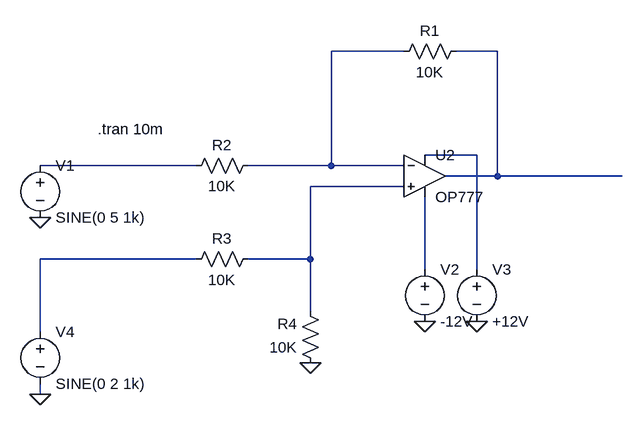
[diagram p0: schematic subtractor1.asc]
subtractor1.asc, the LTspice schematic file:
Version 4.1
SHEET 1 880 680
WIRE 160 -64 48 -64
WIRE 304 -64 240 -64
WIRE 272 96 192 96
WIRE -160 112 -400 112
WIRE 48 112 48 -64
WIRE 48 112 -80 112
WIRE 160 112 48 112
WIRE 304 128 304 -64
WIRE 304 128 224 128
WIRE 496 128 304 128
WIRE 160 144 16 144
WIRE -160 256 -400 256
WIRE 16 256 16 144
WIRE 16 256 -80 256
WIRE 192 272 192 160
WIRE 272 272 272 96
WIRE 16 336 16 256
WIRE -400 368 -400 256
WIRE -400 464 -400 448
FLAG -400 192 0
FLAG 192 352 0
FLAG 272 352 0
FLAG -400 464 0
FLAG 16 416 0
SYMBOL res -64 96 R90
WINDOW 0 0 56 VBottom 2
WINDOW 3 32 56 VTop 2
SYMATTR InstName R2
SYMATTR Value 10K
SYMATTR SpiceLine tol=1 pwr=0.1
SYMBOL voltage -400 96 R0
WINDOW 123 0 0 Left 0
WINDOW 39 24 124 Left 2
SYMATTR InstName V1
SYMATTR Value SINE(0 5 1k)
SYMBOL voltage 192 256 R0
WINDOW 123 0 0 Left 0
WINDOW 39 0 0 Left 0
SYMATTR InstName V2
SYMATTR Value -12V
SYMBOL voltage 272 256 R0
WINDOW 123 0 0 Left 0
WINDOW 39 0 0 Left 0
SYMATTR InstName V3
SYMATTR Value +12V
SYMBOL OpAmps\\OP777 192 64 R0
SYMATTR InstName U2
SYMBOL res -176 272 R270
WINDOW 0 32 56 VTop 2
WINDOW 3 0 56 VBottom 2
SYMATTR InstName R3
SYMATTR Value 10K
SYMATTR SpiceLine tol=1 pwr=0.1
SYMBOL voltage -400 352 R0
WINDOW 123 0 0 Left 0
WINDOW 39 0 0 Left 0
SYMATTR InstName V4
SYMATTR Value SINE(0 2 1k)
SYMBOL res 256 -80 R90
WINDOW 0 0 56 VBottom 2
WINDOW 3 32 56 VTop 2
SYMATTR InstName R1
SYMATTR Value 10K
SYMATTR SpiceLine tol=1 pwr=0.1
SYMBOL res 32 432 R180
WINDOW 0 36 76 Left 2
WINDOW 3 36 40 Left 2
SYMATTR InstName R4
SYMATTR Value 10K
SYMATTR SpiceLine tol=1 pwr=0.1
TEXT -312 56 Left 2 !.tran 10m

The netlist it stands for:
* subtractor1.asc
R2 N001 N004 10K tol=1 pwr=0.1
V1 N004 0 SINE(0 5 1k)
V2 N007 0 -12V
V3 N003 0 +12V
X§U2 N005 N001 N003 N007 N002 OP777  ; pins In+ In- V+ V- OUT
R3 N006 N005 10K tol=1 pwr=0.1
V4 N006 0 SINE(0 2 1k)
R1 N002 N001 10K tol=1 pwr=0.1
R4 0 N005 10K tol=1 pwr=0.1
.tran 10m
.lib ADI.lib
.backanno
.end